# Altium schematic sheet INPUTOUTPUTDIGITAL.SchDoc
size A4; SheetNumber: 15; SheetTotal: 15
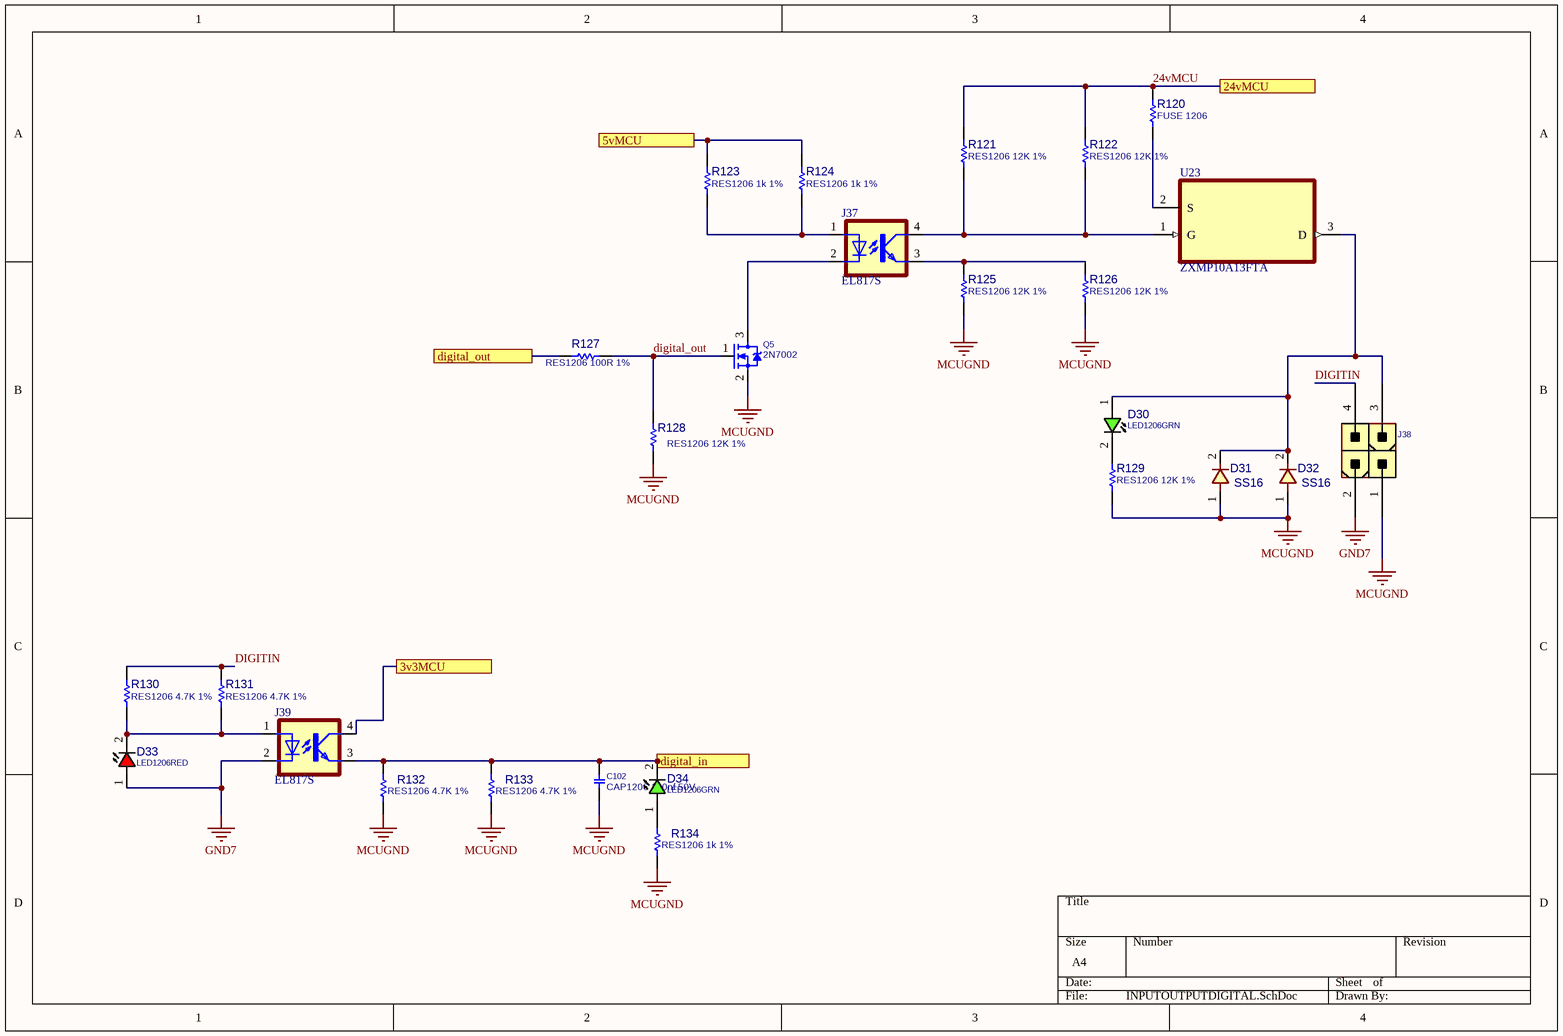
[diagram p0: INPUTOUTPUTDIGITAL.SchDoc]

## Parts
C102  CAP1206 100nf 50V  [C1206]
D30  LED1206GRN  [LED1206GRN]
D31  SS16  [D_SMA]
D32  SS16  [D_SMA]
D33  LED1206RED  [LED1206RED]
D34  LED1206GRN  [LED1206GRN]
J37  EL817S  [SOIC254P1030X460-4N]
J38  CONN_ATXPWR_4  [ATXPWR_4]  (value not drawn)
J39  EL817S  [SOIC254P1030X460-4N]
Q5  2N7002  [SOT23_3]
R120  FUSE 1206  [R1206]
R121  RES1206 12K 1%  [R1206]
R122  RES1206 12K 1%  [R1206]
R123  RES1206 1k 1%  [R1206]
R124  RES1206 1k 1%  [R1206]
R125  RES1206 12K 1%  [R1206]
R126  RES1206 12K 1%  [R1206]
R127  RES1206 100R 1%  [R1206]
R128  RES1206 12K 1%  [R1206]
R129  RES1206 12K 1%  [R1206]
R130  RES1206 4.7K 1%  [R1206]
R131  RES1206 4.7K 1%  [R1206]
R132  RES1206 4.7K 1%  [R1206]
R133  RES1206 4.7K 1%  [R1206]
R134  RES1206 1k 1%  [R1206]
U23  ZXMP10A13FTA  [SOT95P230X110-3N]

## Ports
3v3MCU, 5vMCU, 24vMCU, digital_in, digital_out

## Nets
GND7: D33.1(ANODE) J38.2 J39.2(C)
MCUGND: C102.2 D31.1 D32.1 J38.1 Q5.2(SOURCE) R125.2 R126.2 R128.2 R129.2 R132.1 R133.1 R134.1
3v3MCU: J39.4(COL) ; port 3v3MCU
5vMCU: R123.2 R124.2 ; port 5vMCU
24vMCU: R120.1 R121.1 R122.1 ; port 24vMCU
digital_in: C102.1 D34.2(CATHODE) J39.3(EMIT) R132.2 R133.2 ; port digital_in
digital_out: Q5.1(GATE) R127.2 R128.1
digital_out: R127.1 ; port digital_out  [a separate net that carries the same name]
DIGITIN: J38.4 R130.2 R131.2
NetD30_1: D30.1(ANODE) D31.2 D32.2 J38.3 U23.3(D)
NetD30_2: D30.2(CATHODE) R129.1
NetD33_2: D33.2(CATHODE) J39.1(A) R130.1 R131.1
NetD34_1: D34.1(ANODE) R134.2
NetJ37_1: J37.1(A) R123.1 R124.1
NetJ37_2: J37.2(C) Q5.3(DRAIN)
NetJ37_3: J37.3(EMIT) R125.1 R126.1
NetJ37_4: J37.4(COL) R121.2 R122.2 U23.1(G)
NetR120_2: R120.2 U23.2(S)

## Library data of the parts
C102 = CAP_SMD_MLCC_1206: CAP, MLCC; PARAM: -, -%; MANF_P#: MANF_PART#; PARAM2: -V; PRICE: 100= 1$; MANF: -; ASSEMBLY: ASSEMBLY
D30 D34 = LED_SMD_1206_GRN: LED, SMD, 1206, GREEN; PARAM: 20mA; DESC: DESCRIPTION; PARAM2: 2.2V; MANF: -; ASSEMBLY: ASSEMBLY; PRICE: 36t@Javan; MANF_P#: -; VALUE: LED1206GRN; MountType: SMT; PartType: LED
D31 D32 = DIODE_SMD_1N4001: DIODE, GENERAL PURPOSE, 50V/1A; DESC: DESCRIPTION; PARAM: 50V VRRM; PARAM2: 1A; MANF_P#: 1N4001; MANF: MANF; ASSEMBLY: ASSEMBLY; PRICE: PRICE; VALUE: SS16
D33 = LED_SMD_1206_RED: LED, SMD, 1206, RED; DESC: DESCRIPTION; MANF_P#: MANF_PART#; PARAM2: 1.7~2.4V; MANF: MANF; ASSEMBLY: ASSEMBLY; PRICE: 36t@Javan; VALUE: LED1206RED; MountType: SMT; PartType: LED
J37 J39 = EL817S: Optoisolator Transistor Output 5000Vrms 1 Channel 4-SMD; MF: Everlight Electronics; SnapEDA_Link: https://www.snapeda.com/parts/EL817S/Everlight+Electronics+Co+Ltd/view-part/?ref=snap; Package: SMD-4 Everlight Electronics Co Ltd; Value: *; MP: EL817S; Check_prices: https://www.snapeda.com/parts/EL817S/Everlight+Electronics+Co+Ltd/view-part/?ref=eda
J38 = CONN_ATXPWR_4: CONN, ATX POWER, 4 P; MANF: TE, Molex; MANF_P#: 4-1775099-0, 39281043; VALUE: CONN_ATXPWR_4; MountType: THD; PACKAGE: ATXPWR-4pin; Part Type: Conn.
Q5 = MOSN_2N7002_SOT23: MOSFET, N-CH, 60V, 0.3A; MANF: NXP; ASSEMBLY: ASSEMBLY; MANF_P#: 2N7002; PARAM2: 60v; PARAM: 0.3A; PRICE: 0.3t@Javan; VALUE: 2N7002
R120-R134 = RES_SMD_1206: RESISTOR, SMD; PARAM: 1%, 0.25W; DESC: DESCRIPTION; DIST#: MOUSER; MANF_P#: -; MANF: -; ASSEMBLY: ASSEMBLY; PRICE: -; PARAM2: -
U23 = ZXMP10A13FTA: P-Channel 100 V 600mA (Ta) 625mW (Ta) Surface Mount SOT-23-3; MF: Diodes Inc.; Purchase-URL: https://pricing.snapeda.com/search/part/ZXMP10A13FTA/?ref=eda; Package: SOT-23-3 Diodes Inc.; SnapEDA_Link: https://www.snapeda.com/parts/ZXMP10A13FTA/Diodes+Inc./view-part/?ref=snap; Availability: In Stock; Value: *; MP: ZXMP10A13FTA; Check_prices: https://www.snapeda.com/parts/ZXMP10A13FTA/Diodes+Inc./view-part/?ref=eda; Price: None